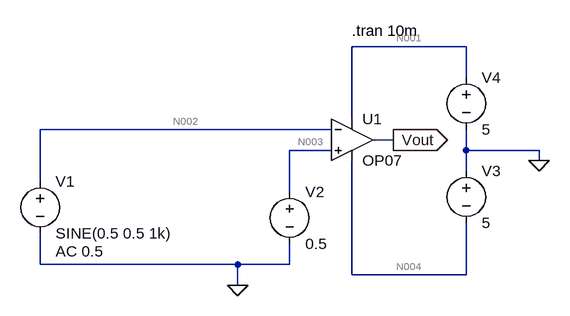
[diagram p0: schematic CL2_T8_AnOpAmpAsAComparator.asc]
CL2_T8_AnOpAmpAsAComparator.asc, the LTspice schematic file:
Version 4.1
SHEET 1 880 680
WIRE 400 32 224 32
WIRE 400 80 400 32
WIRE 224 144 224 32
WIRE 192 160 -256 160
WIRE 288 176 256 176
WIRE 192 192 128 192
WIRE 400 192 400 160
WIRE 512 192 400 192
WIRE 512 208 512 192
WIRE 400 224 400 192
WIRE -256 240 -256 160
WIRE 128 256 128 192
WIRE -256 368 -256 320
WIRE 48 368 -256 368
WIRE 128 368 128 336
WIRE 128 368 48 368
WIRE 224 384 224 208
WIRE 400 384 400 304
WIRE 400 384 224 384
WIRE 48 400 48 368
FLAG 48 400 0
FLAG 512 208 0
FLAG 288 176 Vout
IOPIN 288 176 Out
SYMBOL OpAmps\\OP07 224 112 R0
SYMATTR InstName U1
SYMBOL voltage 400 64 R0
SYMATTR InstName V4
SYMATTR Value 5
SYMBOL voltage 400 208 R0
SYMATTR InstName V3
SYMATTR Value 5
SYMBOL voltage 128 240 R0
WINDOW 123 0 0 Left 0
WINDOW 39 0 0 Left 0
SYMATTR InstName V2
SYMATTR Value 0.5
SYMBOL voltage -256 224 R0
WINDOW 123 24 124 Left 2
WINDOW 39 0 0 Left 0
SYMATTR InstName V1
SYMATTR Value SINE(0.5 0.5 1k)
SYMATTR Value2 AC 0.5
TEXT 224 8 Left 2 !.tran 10m

The netlist it stands for:
* CL2_T8_AnOpAmpAsAComparator.asc
X§U1 N003 N002 N001 N004 Vout LT1001  ; OP07, pins In+ In- V+ V- OUT
V4 N001 0 5
V3 0 N004 5
V2 N003 0 0.5
V1 N002 0 SINE(0.5 0.5 1k) AC 0.5
.tran 10m
.lib LTC.lib
.backanno
.end

* Results of the author's LTspice run, read from the files saved beside the schematic
* Operating Point, zero values left out:
*   V(n001) = 5 V
*   V(n002) = 500 mV
*   V(n003) = 500 mV
*   V(n004) = -5 V
*   I(V3) = -2.25 mA
*   I(V4) = -2.25 mA
*   Ix(u1:3) = 2.25 mA
*   Ix(u1:4) = -2.25 mA
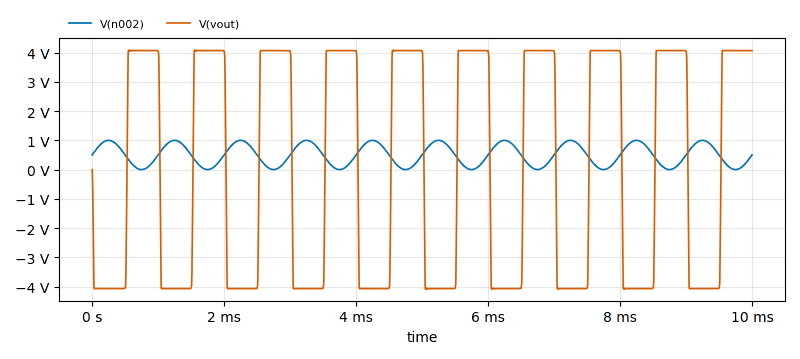
[diagram p1: Transient Analysis of CL2_T8_AnOpAmpAsAComparator.asc, plotted from the saved traces]
* Transient Analysis, 1 run:
*   V(n002): min 0 V, max 1 V, average 500 mV, rms 612.4 mV, last 500 mV
*   V(vout): min -4.078 V, max 4.078 V, average -16.44 mV, rms 3.975 V, last 4.065 V